# Altium schematic sheet STM32.SchDoc
size A3; SheetNumber: 3; SheetTotal: 8
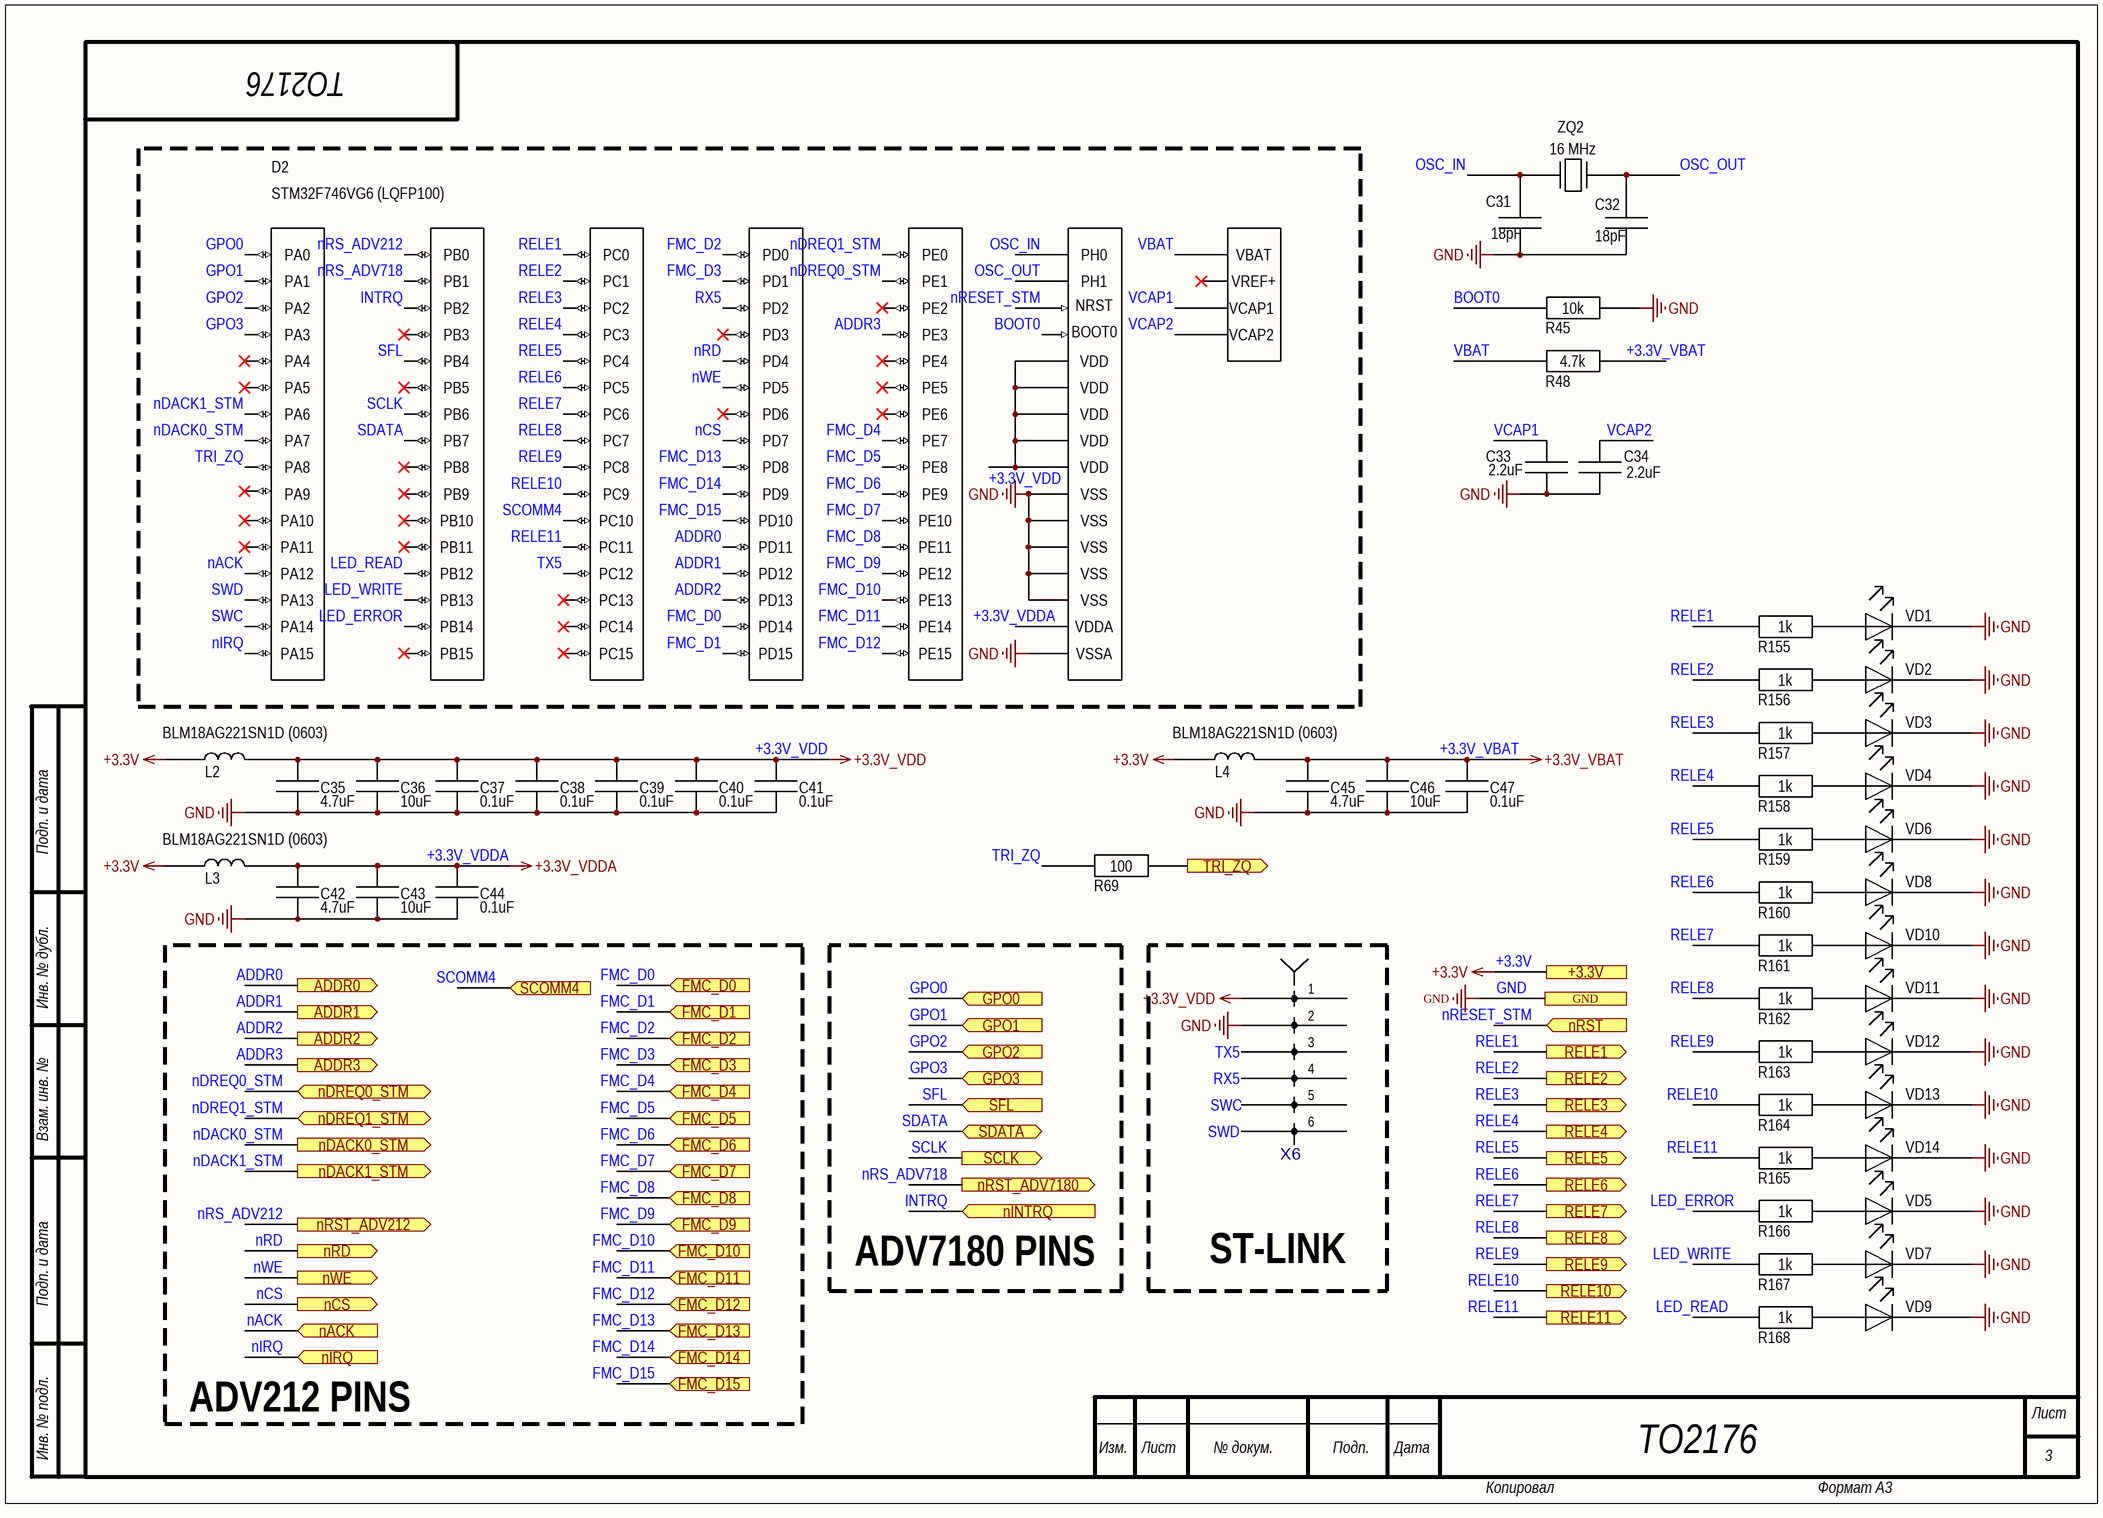
[diagram p0: STM32.SchDoc]

## Parts
C31  18pF  [0603]
C32  18pF  [0603]
C33  2.2uF  [0603]
C34  2.2uF  [0603]
C35  4.7uF  [0603]
C36  10uF  [0603]
C37  0.1uF  [0603]
C38  0.1uF  [0603]
C39  0.1uF  [0603]
C40  0.1uF  [0603]
C41  0.1uF  [0603]
C42  4.7uF  [0603]
C43  10uF  [0603]
C44  0.1uF  [0603]
C45  4.7uF  [0603]
C46  10uF  [0603]
C47  0.1uF  [0603]
D2  STM32F746VG6 (LQFP100)  [LQFP-100]
L2  BLM18AG221SN1D (0603)  [0805]
L3  BLM18AG221SN1D (0603)  [0805]
L4  BLM18AG221SN1D (0603)  [0805]
R45  10k  [0603]
R48  4.7k  [0603]
R69  100  [0603]
R155  1k  [0603]
R156  1k  [0603]
R157  1k  [0603]
R158  1k  [0603]
R159  1k  [0603]
R160  1k  [0603]
R161  1k  [0603]
R162  1k  [0603]
R163  1k  [0603]
R164  1k  [0603]
R165  1k  [0603]
R166  1k  [0603]
R167  1k  [0603]
R168  1k  [0603]
VD1  LED(0805)  [0805(LED)]  (value not drawn)
VD2  LED(0805)  [0805(LED)]  (value not drawn)
VD3  LED(0805)  [0805(LED)]  (value not drawn)
VD4  LED(0805)  [0805(LED)]  (value not drawn)
VD5  LED(0805)  [0805(LED)]  (value not drawn)
VD6  LED(0805)  [0805(LED)]  (value not drawn)
VD7  LED(0805)  [0805(LED)]  (value not drawn)
VD8  LED(0805)  [0805(LED)]  (value not drawn)
VD9  LED(0805)  [0805(LED)]  (value not drawn)
VD10  LED(0805)  [0805(LED)]  (value not drawn)
VD11  LED(0805)  [0805(LED)]  (value not drawn)
VD12  LED(0805)  [0805(LED)]  (value not drawn)
VD13  LED(0805)  [0805(LED)]  (value not drawn)
VD14  LED(0805)  [0805(LED)]  (value not drawn)
X6  PLS6-2,54  [PLS6-2,54]  (value not drawn)
ZQ2  16 MHz  [HC-49SM]

## Blocks framed on the sheet
ST-LINK: X6

## Ports
+3.3V, ADDR0 (out), ADDR1 (out), ADDR2 (out), ADDR3 (out), FMC_D0 (in), FMC_D1 (in), FMC_D2 (in), FMC_D3 (in), FMC_D4 (in), FMC_D5 (in), FMC_D6 (in), FMC_D7 (in), FMC_D8 (in), FMC_D9 (in), FMC_D10 (in), FMC_D11 (in), FMC_D12 (in), FMC_D13 (in), FMC_D14 (in), FMC_D15 (in), GND, GPO0 (in), GPO1 (in), GPO2 (in), GPO3 (in), nACK (in), nCS (out), nDACK0_STM (out), nDACK1_STM (out), nDREQ0_STM (bidir), nDREQ1_STM (bidir), nINTRQ (in), nIRQ (in), nRD (out), nRST (in), nRST_ADV212 (out), nRST_ADV7180 (out), nWE (out), RELE1 (out), RELE2 (out), RELE3 (out), RELE4 (out), RELE5 (out), RELE6 (out), RELE7 (out), RELE8 (out), RELE9 (out), RELE10 (out), RELE11 (out), SCLK (out), SCOMM4 (in), SDATA (bidir), SFL (in), TRI_ZQ (out)

## Nets
+3.3V: L2.1 L3.1 L4.1 ; port +3.3V
+3.3V_VBAT: C45.2 C46.2 C47.2 L4.2 R48.2
+3.3V_VDD: C35.2 C36.2 C37.2 C38.2 C39.2 C40.2 C41.2 D2.11 D2.27 D2.50 D2.75 D2.100 L2.2 X6.1
+3.3V_VDDA: C42.2 C43.2 C44.2 D2.21 L3.2
GND: C31.2 C32.2 C33.1 C34.1 C35.1 C36.1 C37.1 C38.1 C39.1 C40.1 C41.1 C42.1 C43.1 C44.1 C45.1 C46.1 C47.1 D2.10 D2.19 D2.26 D2.49 D2.74 D2.99 R45.2 VD1.2(K) VD2.2(K) VD3.2(K) VD4.2(K) VD5.2(K) VD6.2(K) VD7.2(K) VD8.2(K) VD9.2(K) VD10.2(K) VD11.2(K) VD12.2(K) VD13.2(K) VD14.2(K) X6.2 ; port GND
ADDR0: D2.58 ; port ADDR0
ADDR1: D2.59 ; port ADDR1
ADDR2: D2.60 ; port ADDR2
ADDR3: D2.2 ; port ADDR3
BOOT0: D2.94 R45.1
FMC_D0: D2.61 ; port FMC_D0
FMC_D1: D2.62 ; port FMC_D1
FMC_D2: D2.81 ; port FMC_D2
FMC_D3: D2.82 ; port FMC_D3
FMC_D4: D2.37 ; port FMC_D4
FMC_D5: D2.38 ; port FMC_D5
FMC_D6: D2.39 ; port FMC_D6
FMC_D7: D2.40 ; port FMC_D7
FMC_D8: D2.41 ; port FMC_D8
FMC_D9: D2.42 ; port FMC_D9
FMC_D10: D2.43 ; port FMC_D10
FMC_D11: D2.44 ; port FMC_D11
FMC_D12: D2.45 ; port FMC_D12
FMC_D13: D2.55 ; port FMC_D13
FMC_D14: D2.56 ; port FMC_D14
FMC_D15: D2.57 ; port FMC_D15
GPO0: D2.22 ; port GPO0
GPO1: D2.23 ; port GPO1
GPO2: D2.24 ; port GPO2
GPO3: D2.25 ; port GPO3
INTRQ: D2.36 ; port nINTRQ
LED_ERROR: D2.53 R166.1
LED_READ: D2.51 R168.1
LED_WRITE: D2.52 R167.1
nACK: D2.71 ; port nACK
nCS: D2.88 ; port nCS
nDACK0_STM: D2.31 ; port nDACK0_STM
nDACK1_STM: D2.30 ; port nDACK1_STM
nDREQ0_STM: D2.98 ; port nDREQ0_STM
nDREQ1_STM: D2.97 ; port nDREQ1_STM
nIRQ: D2.77 ; port nIRQ
nRD: D2.85 ; port nRD
nRESET_STM: D2.14 ; port nRST
nRS_ADV212: D2.34 ; port nRST_ADV212
nRS_ADV718: D2.35 ; port nRST_ADV7180
nWE: D2.86 ; port nWE
OSC_IN: C31.1 D2.12 ZQ2.1
OSC_OUT: C32.1 D2.13 ZQ2.2
RELE1: D2.15 R155.1 ; port RELE1
RELE2: D2.16 R156.1 ; port RELE2
RELE3: D2.17 R157.1 ; port RELE3
RELE4: D2.18 R158.1 ; port RELE4
RELE5: D2.32 R159.1 ; port RELE5
RELE6: D2.33 R160.1 ; port RELE6
RELE7: D2.63 R161.1 ; port RELE7
RELE8: D2.64 R162.1 ; port RELE8
RELE9: D2.65 R163.1 ; port RELE9
RELE10: D2.66 R164.1 ; port RELE10
RELE11: D2.79 R165.1 ; port RELE11
RX5: D2.83 X6.4
SCLK: D2.92 ; port SCLK
SCOMM4: D2.78 ; port SCOMM4
SDATA: D2.93 ; port SDATA
SFL: D2.90 ; port SFL
SWC: D2.76 X6.5
SWD: D2.72 X6.6
TRI_ZQ: D2.67 R69.1
TRI_ZQ: R69.2 ; port TRI_ZQ  [a separate net that carries the same name]
TX5: D2.80 X6.3
VBAT: D2.6 R48.1
VCAP1: C33.2 D2.48
VCAP2: C34.2 D2.73
NetR155_2: R155.2 VD1.1(A)
NetR156_2: R156.2 VD2.1(A)
NetR157_2: R157.2 VD3.1(A)
NetR158_2: R158.2 VD4.1(A)
NetR159_2: R159.2 VD6.1(A)
NetR160_2: R160.2 VD8.1(A)
NetR161_2: R161.2 VD10.1(A)
NetR162_2: R162.2 VD11.1(A)
NetR163_2: R163.2 VD12.1(A)
NetR164_2: R164.2 VD13.1(A)
NetR165_2: R165.2 VD14.1(A)
NetR166_2: R166.2 VD5.1(A)
NetR167_2: R167.2 VD7.1(A)
NetR168_2: R168.2 VD9.1(A)

Not connected (* = marked no-connect by the designer): D2 1* 3* 4* 5* 7* 8* 9* 20* 28* 29* 46* 47* 54* 68* 69* 70* 84* 87* 89* 91* 95* 96*

## Notes on the sheet
- ТО2176
- Подп. и дата
- Инв. № дубл.
- Взам. инв. №
- ADV7180 PINS
- ADV212 PINS
- Инв. № подл.
- Изм.
- Лист
- № докум.
- Подп.
- Дата
- 3
- Копировал
- Формат А3
- (in symbol STM32F746VG6) PA0; PB0; PC0; PD0; PE0; PH0; VBAT; PA1; PB1; PC1; PD1; PE1; PH1; VREF+; NRST; PA2; PB2; PC2; PD2; PE2; VCAP1; BOOT0; PA3; PB3; PC3; PD3; PE3; VCAP2; PA4; PB4; PC4; PD4; PE4; VDD; PA5; PB5; PC5; PD5; PE5; PA6; PB6; PC6; PD6; PE6; PA7; PB7; PC7; PD7; PE7; PA8; PB8; PC8; PD8; PE8; PA9; PB9; PC9; PD9; PE9; VSS; PA10; PB10; PC10; PD10; PE10; PA11; PB11; PC11; PD11; PE11; PA12; PB12; PC12; PD12; PE12; PA13; PB13; PC13; PD13; PE13; PA14; PB14; PC14; PD14; PE14; VDDA; PA15; PB15; PC15; PD15; PE15; VSSA

## Library data of the parts
C31-C47 = C0603: ComponentHeigt: 1.3; Firme: AVX; Leadform: SMD; KIND: Конденсатор; ClassName: *; Component Link: *; ComponentWeigt: *; Packaging: 0805; NN: *; Value: *
D2 = STM32F746VG6
L2-L4 = BLM21(0805) Murata: ComponentHeigt: 1.1; Leadform: SMD; Firme: Murata; ClassName: *; Component Link: *; ComponentWeigt: *; Packaging: 1206; NN: *; KIND: *
R45 R48 R69 R155-R168 = R0603 Yageo: ComponentHeigt: 0.5; Leadform: SMD; Firme: Yageo; Kind: Резистор; Packaging: 0402; ClassName: *; Component Link: *; NN: *
VD1-VD14 = LED(0805): ComponentHeigt: 0.75; Leadform: в отверстия; Firme: Kingbright; NN: 24003000; KIND: Светодиод L-1154GD Kingbright; Component Link: *; ClassName: *
X6 = PLS6-2,54: ComponentHeigt: 5.5; Name: Вилка; Specification: Вилка PLD2-2 *; Typ: PLD2-2; ClassName: *; Component Link: *; ComponentWeigt: *; Firme: *; Leadform: *; NN: *; KIND: *
ZQ2 = HC-49SM